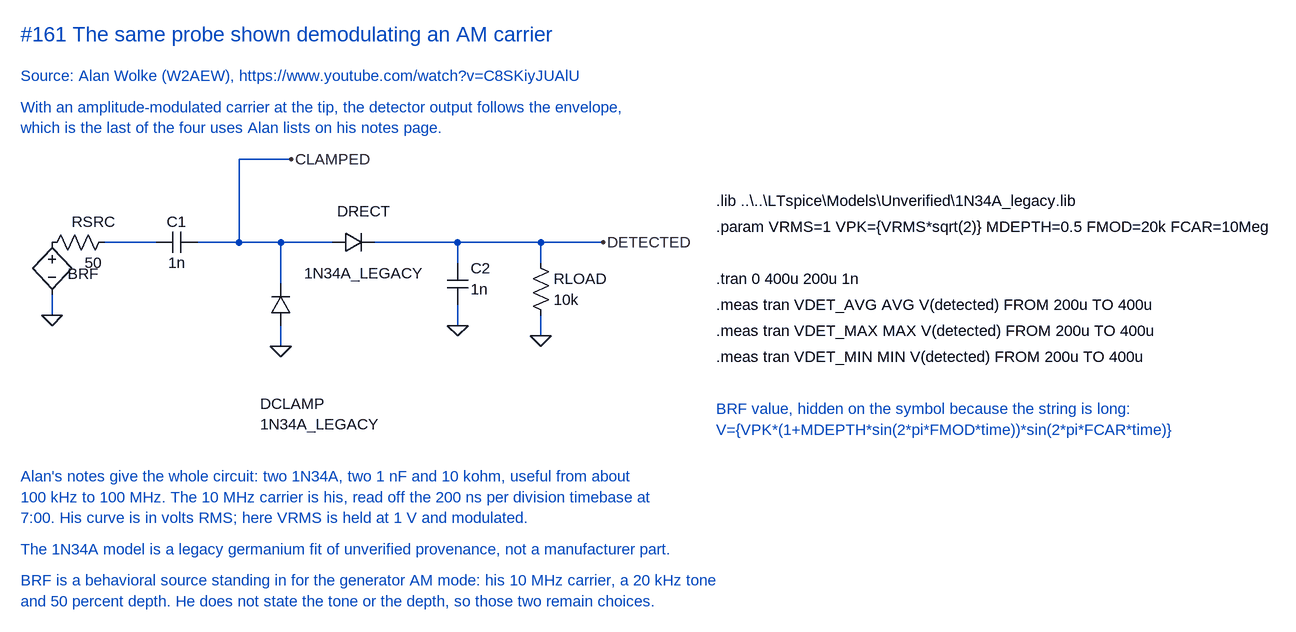
[diagram p0: schematic RF detector probe with AM input.asc]
RF detector probe with AM input.asc, the LTspice schematic file:
Version 4
SHEET 1 2000 1000
WIRE 288 320 368 320
WIRE 432 320 496 320
WIRE 496 320 560 320
WIRE 560 320 640 320
WIRE 496 320 496 192
WIRE 496 192 576 192
WIRE 560 320 560 384
WIRE 560 448 560 480
WIRE 704 320 832 320
WIRE 832 320 960 320
WIRE 960 320 1056 320
WIRE 832 320 832 352
WIRE 832 416 832 448
WIRE 960 320 960 352
WIRE 960 432 960 464
WIRE 208 400 208 432
FLAG 208 432 0
FLAG 560 480 0
FLAG 832 448 0
FLAG 960 464 0
FLAG 576 192 CLAMPED
FLAG 1056 320 DETECTED
SYMBOL bv 208 304 R0
WINDOW 0 24 64 Left 2
WINDOW 3 0 0 Invisible 2
SYMATTR InstName BRF
SYMATTR Value V={VPK*(1+MDEPTH*sin(2*pi*FMOD*time))*sin(2*pi*FCAR*time)}
SYMBOL res 304 304 R90
WINDOW 0 0 32 VBottom 2
WINDOW 3 32 32 VTop 2
SYMATTR InstName RSRC
SYMATTR Value 50
SYMBOL cap 432 304 R90
WINDOW 0 0 32 VBottom 2
WINDOW 3 32 32 VTop 2
SYMATTR InstName C1
SYMATTR Value 1n
SYMBOL diode 576 448 R180
WINDOW 0 48 -120 Right 2
WINDOW 3 48 -152 Right 2
SYMATTR InstName DCLAMP
SYMATTR Value 1N34A_LEGACY
SYMBOL diode 640 336 R270
WINDOW 0 48 48 VTop 2
WINDOW 3 -16 48 VBottom 2
SYMATTR InstName DRECT
SYMATTR Value 1N34A_LEGACY
SYMBOL cap 816 352 R0
WINDOW 0 36 8 Left 2
WINDOW 3 36 40 Left 2
SYMATTR InstName C2
SYMATTR Value 1n
SYMBOL res 944 336 R0
WINDOW 0 36 40 Left 2
WINDOW 3 36 72 Left 2
SYMATTR InstName RLOAD
SYMATTR Value 10k
TEXT 160 0 Left 3 ;#161 The same probe shown demodulating an AM carrier
TEXT 160 64 Left 2 ;Source: Alan Wolke (W2AEW), https://www.youtube.com/watch?v=C8SKiyJUAlU
TEXT 160 112 Left 2 ;With an amplitude-modulated carrier at the tip, the detector output follows the envelope,
TEXT 160 144 Left 2 ;which is the last of the four uses Alan lists on his notes page.
TEXT 1230 256 Left 2 !.lib ..\..\LTspice\Models\Unverified\1N34A_legacy.lib
TEXT 1230 296 Left 2 !.param VRMS=1 VPK={VRMS*sqrt(2)} MDEPTH=0.5 FMOD=20k FCAR=10Meg
TEXT 1230 376 Left 2 !.tran 0 400u 200u 1n
TEXT 1230 416 Left 2 !.meas tran VDET_AVG AVG V(detected) FROM 200u TO 400u
TEXT 1230 456 Left 2 !.meas tran VDET_MAX MAX V(detected) FROM 200u TO 400u
TEXT 1230 496 Left 2 !.meas tran VDET_MIN MIN V(detected) FROM 200u TO 400u
TEXT 160 680 Left 2 ;Alan's notes give the whole circuit: two 1N34A, two 1 nF and 10 kohm, useful from about
TEXT 160 712 Left 2 ;100 kHz to 100 MHz. The 10 MHz carrier is his, read off the 200 ns per division timebase at
TEXT 160 744 Left 2 ;7:00. His curve is in volts RMS; here VRMS is held at 1 V and modulated.
TEXT 160 792 Left 2 ;The 1N34A model is a legacy germanium fit of unverified provenance, not a manufacturer part.
TEXT 160 840 Left 2 ;BRF is a behavioral source standing in for the generator AM mode: his 10 MHz carrier, a 20 kHz tone
TEXT 160 872 Left 2 ;and 50 percent depth. He does not state the tone or the depth, so those two remain choices.
TEXT 1230 576 Left 2 ;BRF value, hidden on the symbol because the string is long:
TEXT 1230 608 Left 2 ;V={VPK*(1+MDEPTH*sin(2*pi*FMOD*time))*sin(2*pi*FCAR*time)}

The netlist it stands for:
* RF detector probe with AM input.asc
BRF P001 0 V={VPK*(1+MDEPTH*sin(2*pi*FMOD*time))*sin(2*pi*FCAR*time)}
RSRC N001 P001 50
C1 CLAMPED N001 1n
DCLAMP 0 CLAMPED 1N34A_LEGACY
DRECT CLAMPED DETECTED 1N34A_LEGACY
C2 DETECTED 0 1n
RLOAD DETECTED 0 10k
.model D D
.lib standard.dio
* #161 The same probe shown demodulating an AM carrier
* Source: Alan Wolke (W2AEW), https://www.youtube.com/watch?v=C8SKiyJUAlU
* With an amplitude-modulated carrier at the tip, the detector output follows the envelope,
* which is the last of the four uses Alan lists on his notes page.
.lib ..\..\LTspice\Models\Unverified\1N34A_legacy.lib
.param VRMS=1 VPK={VRMS*sqrt(2)} MDEPTH=0.5 FMOD=20k FCAR=10Meg
.tran 0 400u 200u 1n
.meas tran VDET_AVG AVG V(detected) FROM 200u TO 400u
.meas tran VDET_MAX MAX V(detected) FROM 200u TO 400u
.meas tran VDET_MIN MIN V(detected) FROM 200u TO 400u
* Alan's notes give the whole circuit: two 1N34A, two 1 nF and 10 kohm, useful from about
* 100 kHz to 100 MHz. The 10 MHz carrier is his, read off the 200 ns per division timebase at
* 7:00. His curve is in volts RMS; here VRMS is held at 1 V and modulated.
* The 1N34A model is a legacy germanium fit of unverified provenance, not a manufacturer part.
* BRF is a behavioral source standing in for the generator AM mode: his 10 MHz carrier, a 20 kHz tone
* and 50 percent depth. He does not state the tone or the depth, so those two remain choices.
* BRF value, hidden on the symbol because the string is long:
* V={VPK*(1+MDEPTH*sin(2*pi*FMOD*time))*sin(2*pi*FCAR*time)}
.backanno
.end